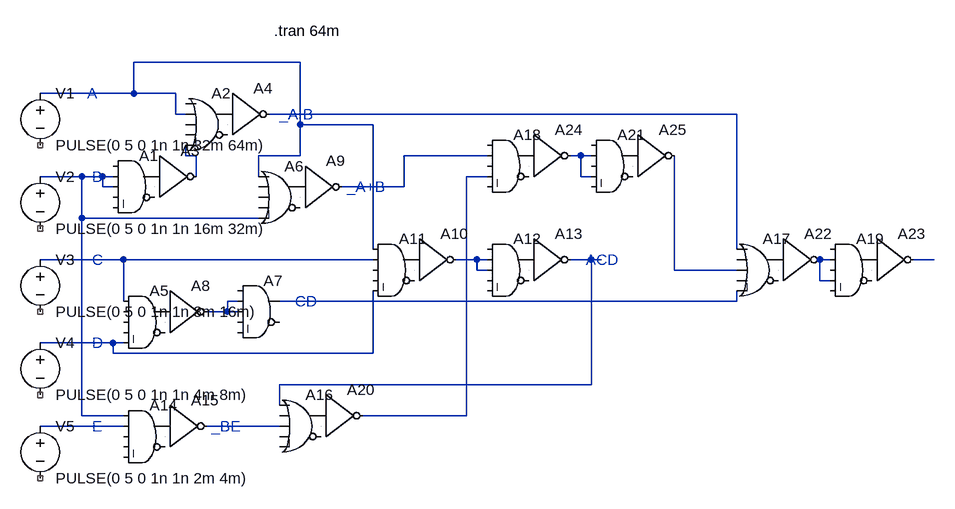
[diagram p0: schematic 12a.asc]
12a.asc, the LTspice schematic file:
Version 4.1
SHEET 1 1700 736
WIRE 464 -64 208 -64
WIRE 208 -16 208 -64
WIRE 208 -16 64 -16
WIRE 272 -16 208 -16
WIRE 272 16 272 -16
WIRE 288 16 272 16
WIRE 1136 16 416 16
WIRE 464 32 464 -64
WIRE 576 32 464 32
WIRE 288 80 288 64
WIRE 304 80 288 80
WIRE 464 80 464 32
WIRE 464 80 400 80
WIRE 752 80 624 80
WIRE 896 80 880 80
WIRE 912 80 896 80
WIRE 128 112 64 112
WIRE 160 112 128 112
WIRE 176 112 160 112
WIRE 304 112 304 80
WIRE 400 112 400 80
WIRE 752 112 720 112
WIRE 896 112 896 80
WIRE 912 112 896 112
WIRE 160 128 160 112
WIRE 176 128 160 128
WIRE 624 128 624 80
WIRE 624 128 528 128
WIRE 128 176 128 112
WIRE 400 176 128 176
WIRE 576 224 576 32
WIRE 1136 224 1136 16
WIRE 192 240 64 240
WIRE 576 240 192 240
WIRE 736 240 704 240
WIRE 752 240 736 240
WIRE 912 240 880 240
WIRE 928 240 912 240
WIRE 1280 240 1264 240
WIRE 1440 240 1408 240
WIRE 736 256 736 240
WIRE 752 256 736 256
WIRE 1040 256 1040 80
WIRE 1136 256 1040 256
WIRE 1264 272 1264 240
WIRE 1280 272 1264 272
WIRE 192 304 192 240
WIRE 368 304 352 304
WIRE 1136 304 1136 288
WIRE 1136 304 432 304
WIRE 352 320 352 304
WIRE 352 320 320 320
WIRE 368 320 352 320
WIRE 176 368 64 368
WIRE 192 368 176 368
WIRE 176 384 176 368
WIRE 576 384 576 288
WIRE 576 384 176 384
WIRE 912 432 912 240
WIRE 912 432 432 432
WIRE 432 464 432 432
WIRE 128 480 128 176
WIRE 192 480 128 480
WIRE 720 480 720 112
WIRE 720 480 560 480
WIRE 192 496 64 496
WIRE 432 496 320 496
SYMBOL voltage 64 -32 R0
WINDOW 123 0 0 Left 0
WINDOW 39 0 0 Left 0
SYMATTR InstName V1
SYMATTR Value PULSE(0 5 0 1n 1n 32m 64m)
SYMBOL voltage 64 96 R0
WINDOW 123 0 0 Left 0
WINDOW 39 0 0 Left 0
SYMATTR InstName V2
SYMATTR Value PULSE(0 5 0 1n 1n 16m 32m)
SYMBOL voltage 64 224 R0
WINDOW 123 0 0 Left 0
WINDOW 39 0 0 Left 0
SYMATTR InstName V3
SYMATTR Value PULSE(0 5 0 1n 1n 8m 16m)
SYMBOL voltage 64 352 R0
WINDOW 123 0 0 Left 0
WINDOW 39 0 0 Left 0
SYMATTR InstName V4
SYMATTR Value PULSE(0 5 0 1n 1n 4m 8m)
SYMBOL voltage 64 480 R0
WINDOW 123 0 0 Left 0
WINDOW 39 0 0 Left 0
SYMATTR InstName V5
SYMATTR Value PULSE(0 5 0 1n 1n 2m 4m)
SYMBOL Digital\\and 208 64 R0
SYMATTR InstName A1
SYMBOL Digital\\or 320 -32 R0
SYMATTR InstName A2
SYMBOL Digital\\inv 240 48 R0
SYMATTR InstName A3
SYMBOL Digital\\inv 352 -48 R0
SYMATTR InstName A4
SYMBOL Digital\\or 432 80 R0
SYMATTR InstName A6
SYMBOL Digital\\and 400 256 R0
SYMATTR InstName A7
SYMBOL Digital\\inv 256 256 R0
SYMATTR InstName A8
SYMBOL Digital\\inv 464 64 R0
SYMATTR InstName A9
SYMBOL Digital\\and 224 272 R0
SYMATTR InstName A5
SYMBOL Digital\\and 608 192 R0
SYMATTR InstName A11
SYMBOL Digital\\and 784 192 R0
SYMATTR InstName A12
SYMBOL Digital\\inv 640 176 R0
SYMATTR InstName A10
SYMBOL Digital\\inv 816 176 R0
SYMATTR InstName A13
SYMBOL Digital\\and 224 448 R0
SYMATTR InstName A14
SYMBOL Digital\\inv 256 432 R0
SYMATTR InstName A15
SYMBOL Digital\\or 464 432 R0
SYMATTR InstName A16
SYMBOL Digital\\or 1168 192 R0
SYMATTR InstName A17
SYMBOL Digital\\and 1312 192 R0
SYMATTR InstName A19
SYMBOL Digital\\inv 496 416 R0
SYMATTR InstName A20
SYMBOL Digital\\inv 1200 176 R0
SYMATTR InstName A22
SYMBOL Digital\\inv 1344 176 R0
SYMATTR InstName A23
SYMBOL Digital\\and 784 32 R0
SYMATTR InstName A18
SYMBOL Digital\\and 944 32 R0
SYMATTR InstName A21
SYMBOL Digital\\inv 816 16 R0
SYMATTR InstName A24
SYMBOL Digital\\inv 976 16 R0
SYMATTR InstName A25
TEXT 424 -112 Left 2 !.tran 64m
TEXT 136 -16 Left 2 ;A
TEXT 144 112 Left 2 ;B
TEXT 144 240 Left 2 ;C
TEXT 144 368 Left 2 ;D
TEXT 144 496 Left 2 ;E
TEXT 432 16 Left 2 ;_A B
TEXT 456 304 Left 2 ;CD
TEXT 536 128 Left 2 ;_A+B
TEXT 904 240 Left 2 ;ACD
TEXT 328 496 Left 2 ;_BE

The netlist it stands for:
* 12a.asc
V1 N001 NC_01 PULSE(0 5 0 1n 1n 32m 64m)
V2 N006 NC_02 PULSE(0 5 0 1n 1n 16m 32m)
V3 N008 NC_03 PULSE(0 5 0 1n 1n 8m 16m)
V4 N016 NC_04 PULSE(0 5 0 1n 1n 4m 8m)
V5 N017 NC_05 PULSE(0 5 0 1n 1n 2m 4m)
A1 0 N006 N006 0 0 0 P001 0 AND
A2 0 N001 0 0 N003 0 P002 0 OR
A3 P001 0 0 0 0 N003 0 0 BUF
A4 P002 0 0 0 0 N002 0 0 BUF
A6 N001 0 0 0 N006 0 P003 0 OR
A7 0 N014 N014 0 0 0 N015 0 AND
A8 P004 0 0 0 0 N014 0 0 BUF
A9 P003 0 0 0 0 N004 0 0 BUF
A5 N008 0 0 0 N016 0 P004 0 AND
A11 N001 N008 0 0 N016 0 P005 0 AND
A12 0 N009 N009 0 0 0 P006 0 AND
A10 P005 0 0 0 0 N009 0 0 BUF
A13 P006 0 0 0 0 N010 0 0 BUF
A14 N006 N017 0 0 0 0 P007 0 AND
A15 P007 0 0 0 0 N018 0 0 BUF
A16 N010 0 N018 0 0 0 P008 0 OR
A17 N002 0 N013 0 N015 0 P009 0 OR
A19 0 N011 0 N011 0 0 P010 0 AND
A20 P008 0 0 0 0 N007 0 0 BUF
A22 P009 0 0 0 0 N011 0 0 BUF
A23 P010 0 0 0 0 N012 0 0 BUF
A18 0 N004 0 N007 0 0 P011 0 AND
A21 0 N005 0 N005 0 0 P012 0 AND
A24 P011 0 0 0 0 N005 0 0 BUF
A25 P012 0 0 0 0 N013 0 0 BUF
.tran 64m
* A
* B
* C
* D
* E
* _A B
* CD
* _A+B
* ACD
* _BE
.backanno
.end